# Altium schematic sheet 15_ETH_PHY.SchDoc
size A3; SheetNumber: 5; SheetTotal: 21
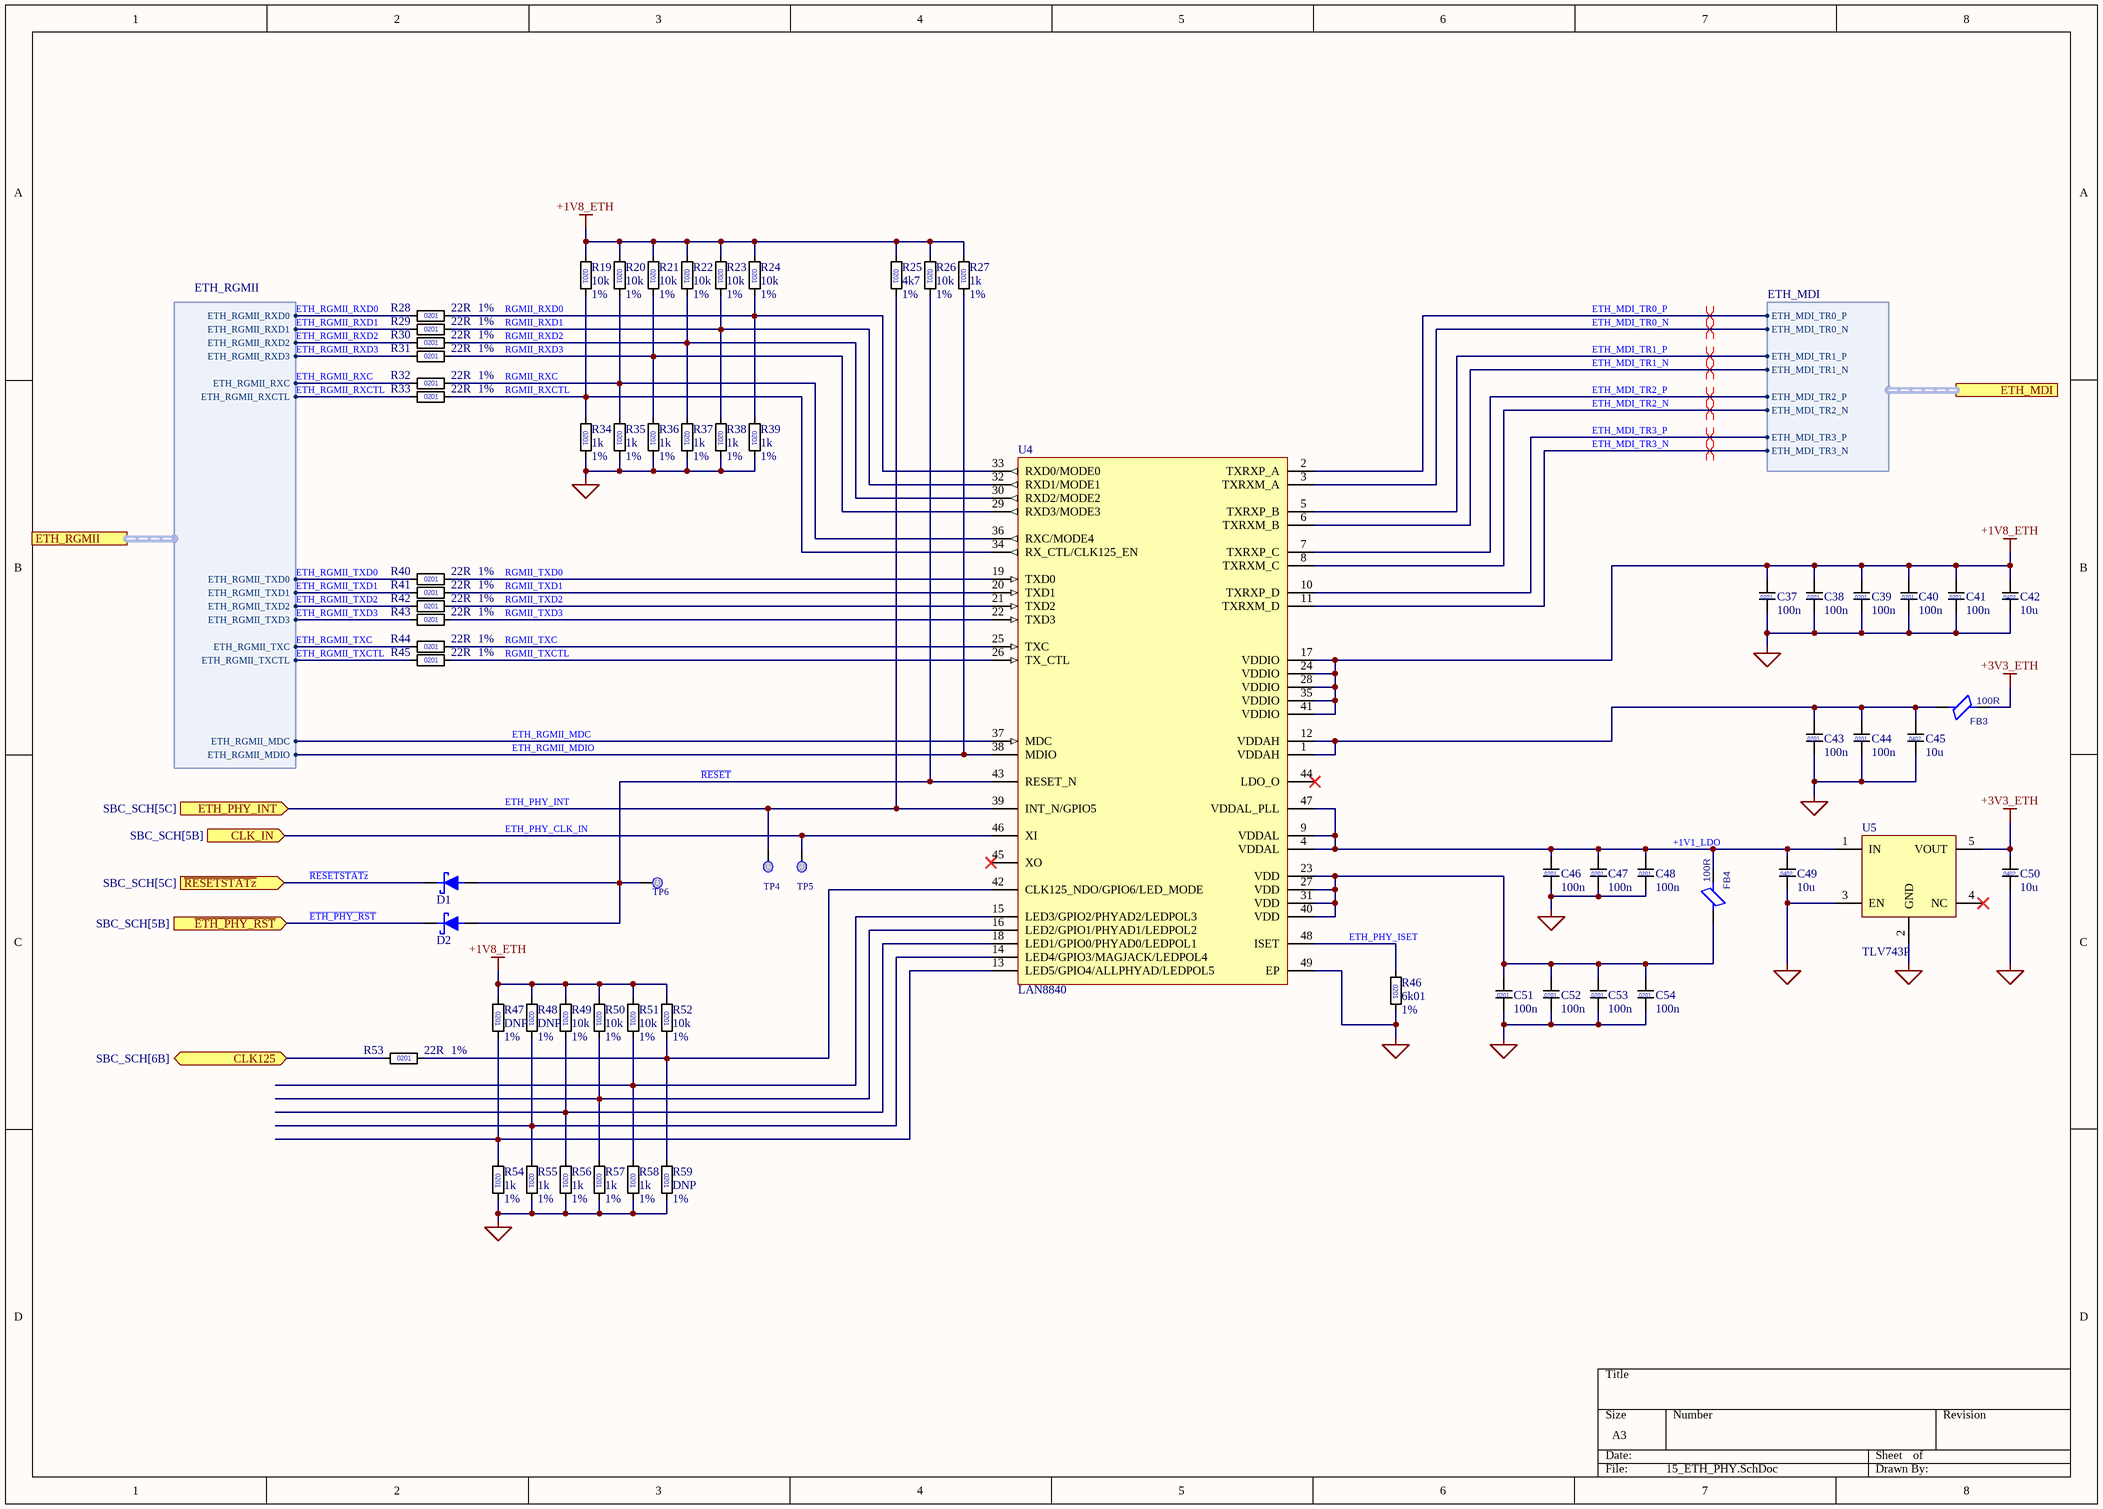
[diagram p0: 15_ETH_PHY.SchDoc]

## Parts
C37  value 100n  [C0201]  (hidden comment: C_0201)
C38  value 100n  [C0201]  (hidden comment: C_0201)
C39  value 100n  [C0201]  (hidden comment: C_0201)
C40  value 100n  [C0201]  (hidden comment: C_0201)
C41  value 100n  [C0201]  (hidden comment: C_0201)
C42  value 10u  [C0402]  (hidden comment: 4u7)
C43  value 100n  [C0201]  (hidden comment: C_0201)
C44  value 100n  [C0201]  (hidden comment: C_0201)
C45  value 10u  [C0402]  (hidden comment: 4u7)
C46  value 100n  [C0201]  (hidden comment: C_0201)
C47  value 100n  [C0201]  (hidden comment: C_0201)
C48  value 100n  [C0201]  (hidden comment: C_0201)
C49  value 10u  [C0402]  (hidden comment: 4u7)
C50  value 10u  [C0402]  (hidden comment: 4u7)
C51  value 100n  [C0201]  (hidden comment: C_0201)
C52  value 100n  [C0201]  (hidden comment: C_0201)
C53  value 100n  [C0201]  (hidden comment: C_0201)
C54  value 100n  [C0201]  (hidden comment: C_0201)
D1  D_Filled  [D_SOD-523]  (value not drawn)
D2  D_Filled  [D_SOD-523]  (value not drawn)
FB3  value 100R  [FB0201]  (hidden comment: FB_0201)
FB4  value 100R  [FB0201]  (hidden comment: FB_0201)
R19  value 10k  Tolerance: 1%  [R0201]  (hidden comment: 0201)
R20  value 10k  Tolerance: 1%  [R0201]  (hidden comment: 0201)
R21  value 10k  Tolerance: 1%  [R0201]  (hidden comment: 0201)
R22  value 10k  Tolerance: 1%  [R0201]  (hidden comment: 0201)
R23  value 10k  Tolerance: 1%  [R0201]  (hidden comment: 0201)
R24  value 10k  Tolerance: 1%  [R0201]  (hidden comment: 0201)
R25  value 4k7  Tolerance: 1%  [R0201]  (hidden comment: 0201)
R26  value 10k  Tolerance: 1%  [R0201]  (hidden comment: 0201)
R27  value 1k  Tolerance: 1%  [R0201]  (hidden comment: 0201)
R28  value 22R  Tolerance: 1%  [R0201]  (hidden comment: 0201)
R29  value 22R  Tolerance: 1%  [R0201]  (hidden comment: 0201)
R30  value 22R  Tolerance: 1%  [R0201]  (hidden comment: 0201)
R31  value 22R  Tolerance: 1%  [R0201]  (hidden comment: 0201)
R32  value 22R  Tolerance: 1%  [R0201]  (hidden comment: 0201)
R33  value 22R  Tolerance: 1%  [R0201]  (hidden comment: 0201)
R34  value 1k  Tolerance: 1%  [R0201]  (hidden comment: 0201)
R35  value 1k  Tolerance: 1%  [R0201]  (hidden comment: 0201)
R36  value 1k  Tolerance: 1%  [R0201]  (hidden comment: 0201)
R37  value 1k  Tolerance: 1%  [R0201]  (hidden comment: 0201)
R38  value 1k  Tolerance: 1%  [R0201]  (hidden comment: 0201)
R39  value 1k  Tolerance: 1%  [R0201]  (hidden comment: 0201)
R40  value 22R  Tolerance: 1%  [R0201]  (hidden comment: 0201)
R41  value 22R  Tolerance: 1%  [R0201]  (hidden comment: 0201)
R42  value 22R  Tolerance: 1%  [R0201]  (hidden comment: 0201)
R43  value 22R  Tolerance: 1%  [R0201]  (hidden comment: 0201)
R44  value 22R  Tolerance: 1%  [R0201]  (hidden comment: 0201)
R45  value 22R  Tolerance: 1%  [R0201]  (hidden comment: 0201)
R46  value 6k01  Tolerance: 1%  [R0201]  (hidden comment: 0201)
R47  value DNP  Tolerance: 1%  [R0201]  (hidden comment: 0201)
R48  value DNP  Tolerance: 1%  [R0201]  (hidden comment: 0201)
R49  value 10k  Tolerance: 1%  [R0201]  (hidden comment: 0201)
R50  value 10k  Tolerance: 1%  [R0201]  (hidden comment: 0201)
R51  value 10k  Tolerance: 1%  [R0201]  (hidden comment: 0201)
R52  value 10k  Tolerance: 1%  [R0201]  (hidden comment: 0201)
R53  value 22R  Tolerance: 1%  [R0201]  (hidden comment: 0201)
R54  value 1k  Tolerance: 1%  [R0201]  (hidden comment: 0201)
R55  value 1k  Tolerance: 1%  [R0201]  (hidden comment: 0201)
R56  value 1k  Tolerance: 1%  [R0201]  (hidden comment: 0201)
R57  value 1k  Tolerance: 1%  [R0201]  (hidden comment: 0201)
R58  value 1k  Tolerance: 1%  [R0201]  (hidden comment: 0201)
R59  value DNP  Tolerance: 1%  [R0201]  (hidden comment: 0201)
TP4  Testpoint 0.5mm  [TP_0.50mm]  (value not drawn)  (no BOM)
TP5  Testpoint 0.5mm  [TP_0.50mm]  (value not drawn)  (no BOM)
TP6  Testpoint 0.5mm  [TP_0.50mm]  (value not drawn)  (no BOM)
U4  LAN8840  [QFN-48-1EP_7x7mm_P0.5mm_EP5.15x5.15mm]
U5  TLV743P  [SOT-23-5]

## Ports
CLK125 (bidir, see SBC_SCH[6B]), CLK_IN (in, see SBC_SCH[5B]), ETH_MDI (harness ETH_MDI, see SBC_SCH[6B], ETH_Magjack[2B]), ETH_PHY_INT (in, see SBC_SCH[5C]), ETH_RGMII (harness ETH_RGMII, see SBC_SCH[5B], SoC_Interfaces[6C]), ~{ETH_PHY_RST} (in, see SBC_SCH[5B]), ~{RESETSTATz} (in, see SBC_SCH[5C])

## Harnesses
ETH_MDI: ETH_MDI_TR0_P, ETH_MDI_TR0_N, ETH_MDI_TR1_P, ETH_MDI_TR1_N, ETH_MDI_TR2_P, ETH_MDI_TR2_N, ETH_MDI_TR3_P, ETH_MDI_TR3_N
ETH_RGMII: ETH_RGMII_RXD0, ETH_RGMII_RXD1, ETH_RGMII_RXD2, ETH_RGMII_RXD3, ETH_RGMII_RXC, ETH_RGMII_RXCTL, ETH_RGMII_TXD0, ETH_RGMII_TXD1, ETH_RGMII_TXD2, ETH_RGMII_TXD3, ETH_RGMII_TXC, ETH_RGMII_TXCTL, ETH_RGMII_MDC, ETH_RGMII_MDIO

## Nets
+1V8_ETH: C37.1 C38.1 C39.1 C40.1 C41.1 C42.1 R19.1 R20.1 R21.1 R22.1 R23.1 R24.1 R25.1 R26.1 R27.1 R47.1 R48.1 R49.1 R50.1 R51.1 R52.1 U4.17(VDDIO) U4.24(VDDIO) U4.28(VDDIO) U4.35(VDDIO) U4.41(VDDIO)
+3V3_ETH: C50.1 FB3.2 U5.5(VOUT)
GND: C37.2 C38.2 C39.2 C40.2 C41.2 C42.2 C43.2 C44.2 C45.2 C46.2 C47.2 C48.2 C49.2 C50.2 C51.2 C52.2 C53.2 C54.2 R34.2 R35.2 R36.2 R37.2 R38.2 R39.2 R46.2 R54.2 R55.2 R56.2 R57.2 R58.2 R59.2 U4.49(EP) U5.2(GND) U5.3(EN)
+1V1_LDO: C46.1 C47.1 C48.1 C49.1 FB4.2 U4.4(VDDAL) U4.9(VDDAL) U4.47(VDDAL_PLL) U5.1(IN)
~{ETH_PHY_RST}: D2.1(K) ; port ~{ETH_PHY_RST}
~{RESET}: D1.2(A) D2.2(A) R26.2 TP6.TP U4.43(RESET_N)
~{RESETSTATz}: D1.1(K) ; port ~{RESETSTATz}
CLK125: R53.1 ; port CLK125
ETH_MDI_TR0_N: U4.3(TXRXM_A) ; port ETH_MDI.ETH_MDI_TR0_N
ETH_MDI_TR0_P: U4.2(TXRXP_A) ; port ETH_MDI.ETH_MDI_TR0_P
ETH_MDI_TR1_N: U4.6(TXRXM_B) ; port ETH_MDI.ETH_MDI_TR1_N
ETH_MDI_TR1_P: U4.5(TXRXP_B) ; port ETH_MDI.ETH_MDI_TR1_P
ETH_MDI_TR2_N: U4.8(TXRXM_C) ; port ETH_MDI.ETH_MDI_TR2_N
ETH_MDI_TR2_P: U4.7(TXRXP_C) ; port ETH_MDI.ETH_MDI_TR2_P
ETH_MDI_TR3_N: U4.11(TXRXM_D) ; port ETH_MDI.ETH_MDI_TR3_N
ETH_MDI_TR3_P: U4.10(TXRXP_D) ; port ETH_MDI.ETH_MDI_TR3_P
ETH_PHY_CLK_IN: TP5.TP U4.46(XI) ; port CLK_IN
ETH_PHY_INT: R25.2 TP4.TP U4.39(INT_N/GPIO5) ; port ETH_PHY_INT
ETH_PHY_ISET: R46.1 U4.48(ISET)
ETH_RGMII_MDC: U4.37(MDC) ; port ETH_RGMII.ETH_RGMII_MDC
ETH_RGMII_MDIO: R27.2 U4.38(MDIO) ; port ETH_RGMII.ETH_RGMII_MDIO
ETH_RGMII_RXC: R32.1 ; port ETH_RGMII.ETH_RGMII_RXC
ETH_RGMII_RXCTL: R33.1 ; port ETH_RGMII.ETH_RGMII_RXCTL
ETH_RGMII_RXD0: R28.1 ; port ETH_RGMII.ETH_RGMII_RXD0
ETH_RGMII_RXD1: R29.1 ; port ETH_RGMII.ETH_RGMII_RXD1
ETH_RGMII_RXD2: R30.1 ; port ETH_RGMII.ETH_RGMII_RXD2
ETH_RGMII_RXD3: R31.1 ; port ETH_RGMII.ETH_RGMII_RXD3
ETH_RGMII_TXC: R44.1 ; port ETH_RGMII.ETH_RGMII_TXC
ETH_RGMII_TXCTL: R45.1 ; port ETH_RGMII.ETH_RGMII_TXCTL
ETH_RGMII_TXD0: R40.1 ; port ETH_RGMII.ETH_RGMII_TXD0
ETH_RGMII_TXD1: R41.1 ; port ETH_RGMII.ETH_RGMII_TXD1
ETH_RGMII_TXD2: R42.1 ; port ETH_RGMII.ETH_RGMII_TXD2
ETH_RGMII_TXD3: R43.1 ; port ETH_RGMII.ETH_RGMII_TXD3
RGMII_RXC: R20.2 R32.2 R35.1 U4.36(RXC/MODE4)
RGMII_RXCTL: R19.2 R33.2 R34.1 U4.34(RX_CTL/CLK125_EN)
RGMII_RXD0: R24.2 R28.2 R39.1 U4.33(RXD0/MODE0)
RGMII_RXD1: R23.2 R29.2 R38.1 U4.32(RXD1/MODE1)
RGMII_RXD2: R22.2 R30.2 R37.1 U4.30(RXD2/MODE2)
RGMII_RXD3: R21.2 R31.2 R36.1 U4.29(RXD3/MODE3)
RGMII_TXC: R44.2 U4.25(TXC)
RGMII_TXCTL: R45.2 U4.26(TX_CTL)
RGMII_TXD0: R40.2 U4.19(TXD0)
RGMII_TXD1: R41.2 U4.20(TXD1)
RGMII_TXD2: R42.2 U4.21(TXD2)
RGMII_TXD3: R43.2 U4.22(TXD3)
NetC43_1: C43.1 C44.1 C45.1 FB3.1 U4.1(VDDAH) U4.12(VDDAH)
NetC51_1: C51.1 C52.1 C53.1 C54.1 FB4.1 U4.23(VDD) U4.27(VDD) U4.31(VDD) U4.40(VDD)
NetR47_2: R47.2 R54.1 U4.13(LED5/GPIO4/ALLPHYAD/LEDPOL5)
NetR48_2: R48.2 R55.1 U4.14(LED4/GPIO3/MAGJACK/LEDPOL4)
NetR49_2: R49.2 R56.1 U4.18(LED1/GPIO0/PHYAD0/LEDPOL1)
NetR50_2: R50.2 R57.1 U4.16(LED2/GPIO1/PHYAD1/LEDPOL2)
NetR51_2: R51.2 R58.1 U4.15(LED3/GPIO2/PHYAD2/LEDPOL3)
NetR52_2: R52.2 R53.2 R59.1 U4.42(CLK125_NDO/GPIO6/LED_MODE)

Not connected (* = marked no-connect by the designer): U4 44(LDO_O)* 45(XO)*; U5 4(NC)*

## Layout directives
differential pair; differential pair class DIFF100: ETH_MDI_TR0_N, ETH_MDI_TR0_P, ETH_MDI_TR1_N, ETH_MDI_TR1_P, ETH_MDI_TR2_N, ETH_MDI_TR2_P, ETH_MDI_TR3_N, ETH_MDI_TR3_P

## Notes on the sheet
- (in symbol C_0201) 0201
- (in symbol C_0402) 0402

## Library data of the parts
C37-C41 C43 C44 C46-C48 C51-C54 = C_0201: MLCC 0201; Manufacturer_Name: *; Manufacturer_Part_Number: *
C42 C45 C49 C50 = C_0402: MLCC 0402; Manufacturer_Name: *; Manufacturer_Part_Number: *
D1 D2 = D_Filled: Diode, filled shape; Sim.Device: D; Sim.Pins: 1=K 2=A; Value: *; Manufacturer_Name: *; Manufacturer Part Number: *
FB3 FB4 = FB_0201: Ferrite bead; Parameter 1: *
R19-R59 = R_0201: Manufacturer_Name: *; Manufacturer_Part_Number: *
U4 = LAN8840: Gigabit Ethernet Transceiver with RGMII Interface and IEEE 1588v2 Support, VQFN-48; KiCad_Footprint: Package_DFN_QFN:QFN-48-1EP_7x7mm_P0.5mm_EP5.15x5.15mm; Datasheet: https://ww1.microchip.com/downloads/aemDocuments/documents/UNG/ProductDocuments/DataSheets/LAN8840-Data-Sheet-DS00004727.pdf; ComponentLink1Description: Datasheet; ComponentLink1URL: https://ww1.microchip.com/downloads/aemDocuments/documents/UNG/ProductDocuments/DataSheets/LAN8840-Data-Sheet-DS00004727.pdf; Manufacturer_Name: *; Manufacturer_Part_Number: *
U5 = TLV743P: Linear Voltage Regulator IC Positive Fixed 1 Output 300mA SOT-23-5; Manufacturer_Name: Texas Instruments; Manufacturer_Part_Number: TLV74311PDBVR; Value: TLV74311PDBVR